# Altium schematic sheet Voice.SchDoc
size A4
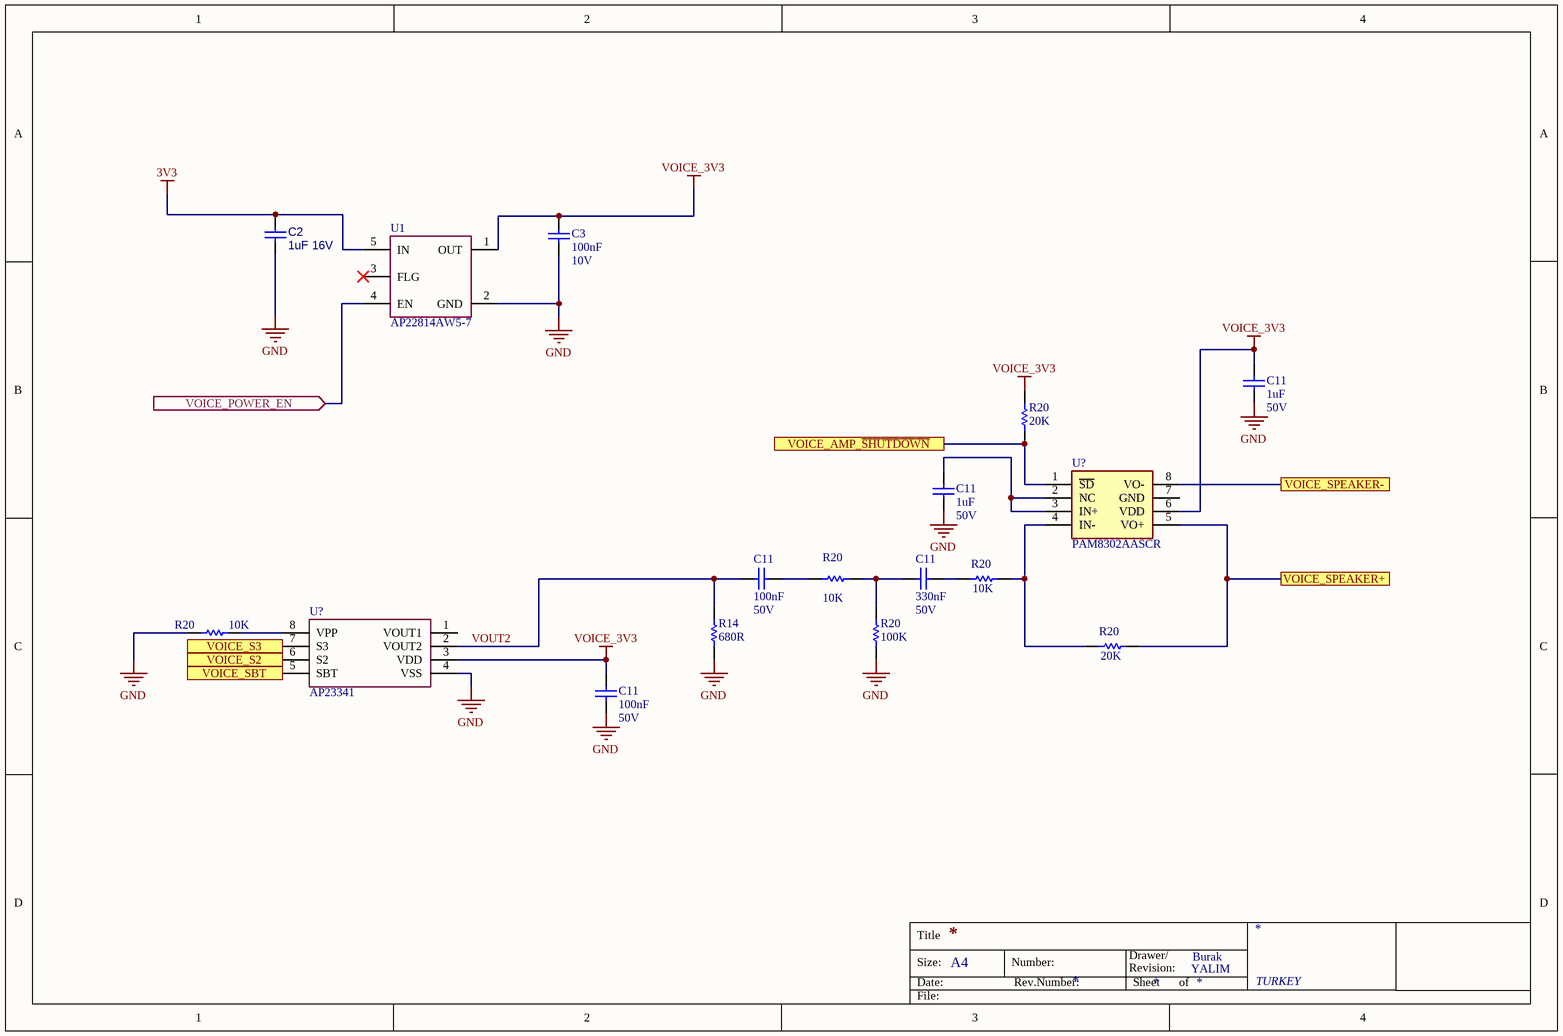
[diagram p0: Voice.SchDoc]

## Parts
(Parts that share a designator on the sheet are numbered #1, #2 ... from top to bottom, then left to right.)
C2  value 1uF 16V  [CAP_0603]  (hidden comment: CL10A105KO8NNNC)
C3  value 100nF  Voltage: 10V  [CAP_0402]  (hidden comment: CAP)
C11#1  value 1uF  Voltage: 50V  [CAP_0402]  (hidden comment: CAP)
C11#2  value 1uF  Voltage: 50V  [CAP_0402]  (hidden comment: CAP)
C11#3  value 100nF  Voltage: 50V  [CAP_0402]  (hidden comment: CAP)
C11#4  value 330nF  Voltage: 50V  [CAP_0402]  (hidden comment: CAP)
C11#5  value 100nF  Voltage: 50V  [CAP_0402]  (hidden comment: CAP)
R14  value 680R  [RES_0402]  (hidden comment: RES)
R20#1  value 20K  [RES_0402]  (hidden comment: RES)
R20#2  value 10K  [RES_0402]  (hidden comment: RES)
R20#3  value 10K  [RES_0402]  (hidden comment: RES)
R20#4  value 100K  [RES_0402]  (hidden comment: RES)
R20#5  value 10K  [RES_0402]  (hidden comment: RES)
R20#6  value 20K  [RES_0402]  (hidden comment: RES)
U1  AP22814AW5-7  [SOT95P285X140-5N]
U?#1  PAM8302AASCR  [SOP65P490X110-8N]
U?#2  AP23341  [SO-8]

## Ports
VOICE_AMP_~{SHUTDOWN}, VOICE_POWER_EN (in), VOICE_S2, VOICE_S3, VOICE_SBT, VOICE_SPEAKER+, VOICE_SPEAKER-

## Nets
3V3: C2.1 U1.5(IN)
GND: C2.2 C3.1 C11#1.2 C11#2.2 C11#5.2 R14.1 R20#4.2 R20#5.2 U1.2(GND) U?#2.4(VSS)
VOICE_3V3: C3.2 C11#1.1 C11#5.1 R20#1.1 U1.1(OUT) U?#1.6(VDD) U?#2.3(VDD)
VOICE_AMP_~{SHUTDOWN}: R20#1.2 U?#1.1(~{SD}) ; port VOICE_AMP_~{SHUTDOWN}
VOICE_POWER_EN: U1.4(EN) ; port VOICE_POWER_EN
VOICE_S2: U?#2.6(S2) ; port VOICE_S2
VOICE_S3: U?#2.7(S3) ; port VOICE_S3
VOICE_SBT: U?#2.5(SBT) ; port VOICE_SBT
VOICE_SPEAKER+: R20#6.1 U?#1.5(VO+) ; port VOICE_SPEAKER+
VOICE_SPEAKER-: U?#1.8(VO-) ; port VOICE_SPEAKER-
VOUT2: C11#3.1 R14.2 U?#2.2(VOUT2)
NetC11#2_1: C11#2.1 U?#1.2(NC) U?#1.3(IN+)
NetC11#3_2: C11#3.2 R20#2.2
NetC11#4_1: C11#4.1 R20#2.1 R20#4.1
NetC11#4_2: C11#4.2 R20#3.2
NetR20#3_1: R20#3.1 R20#6.2 U?#1.4(IN-)
NetR20#5_1: R20#5.1 U?#2.8(VPP)

Not connected (* = marked no-connect by the designer): U1 3(FLG)*; U?#1 7(GND); U?#2 1(VOUT1)

## Notes on the sheet
- Title
- Size:
- Date:
- A4
- Number:
- Rev.Number:
- Revision:
- Drawer/
- Sheet
- of
- YALIM
- Burak
- TURKEY
- File:

## Library data of the parts
C2 = CL10A105KO8NNNC: MLCC (1608) 0603 1uF 16VDC ±10% X5R; Manufacturer: SAMSUNG; Package: 0603 (1608 Metric); Manufacturer Part Number: CL10A105KO8NNNC; Supplier Part Number 1: CL10A105KO8NNNC; Supplier Part Number 2: 1276-1034-2-ND; Supplier Part Number 3: 187-CL10A105KO8NNNC; Supplier 1: OZDISAN; Supplier 2: DIGIKEY; Supplier 3: MOUSER
C3 = C01794: MLCC (1005) 0402 100nF 10VDC ±10% X7R; Manufacturer: Samsung; Manufacturer Part Number: CL05B104KP5NNNC
C11#1-C11#5 = C01763: CAP CER 100nF 50VDC %10 X7R SMD; Manufacturer: Samsung; Manufacturer Part Number: CL10B104KB8NNNL
R14 = R03000: RES 0603 47K Ohms 1% 1/10W-S 100PPM; Manufacturer: ROYALOHM; Manufacturer Part Number: 0603SAF4702T5E
R20#1-R20#6 = R02995: RES 0603 10k Ohms %1 1/10W 100PPM; Manufacturer: ROYALOHM; Manufacturer Part Number: 0603SAF1002T5E
U1 = AP22814AW5-7: IC PWR SWITCH P-CHAN 1:1 SOT25; Manufacturer: Diodes Incorporated; Manufacturer Part Number: AP22814AW5-7
U?#1 = PAM8302AASCR: IC-8302 AMPLIFIER CLASS D 8-MSOP; Manufacturer_Name: Diodes Incorporated; Datasheet Link: https://www.diodes.com/assets/Datasheets/PAM8302A.pdf; Height: 1.1mm; Manufacturer_Part_Number: PAM8302AASCR; Mouser Part Number: 621-PAM8302AASCR; Mouser Price/Stock: https://www.mouser.co.uk/ProductDetail/Diodes-Incorporated/PAM8302AASCR?qs=pYVYkI7xuRXTVZEQSGcDyg%3D%3D; Arrow Part Number: PAM8302AASCR; Arrow Price/Stock: https://www.arrow.com/en/products/pam8302aascr/diodes-incorporated?utm_currency=USD&region=nac
U?#2 = AP23341: IC-AP23341 VOICE OPT. SOP8 SMD; Manufacturer: APLUS Inc; Manufacturer Part Number: AP23341